# EAGLE design cc1101-breakout (EAGLE 6.5.0)
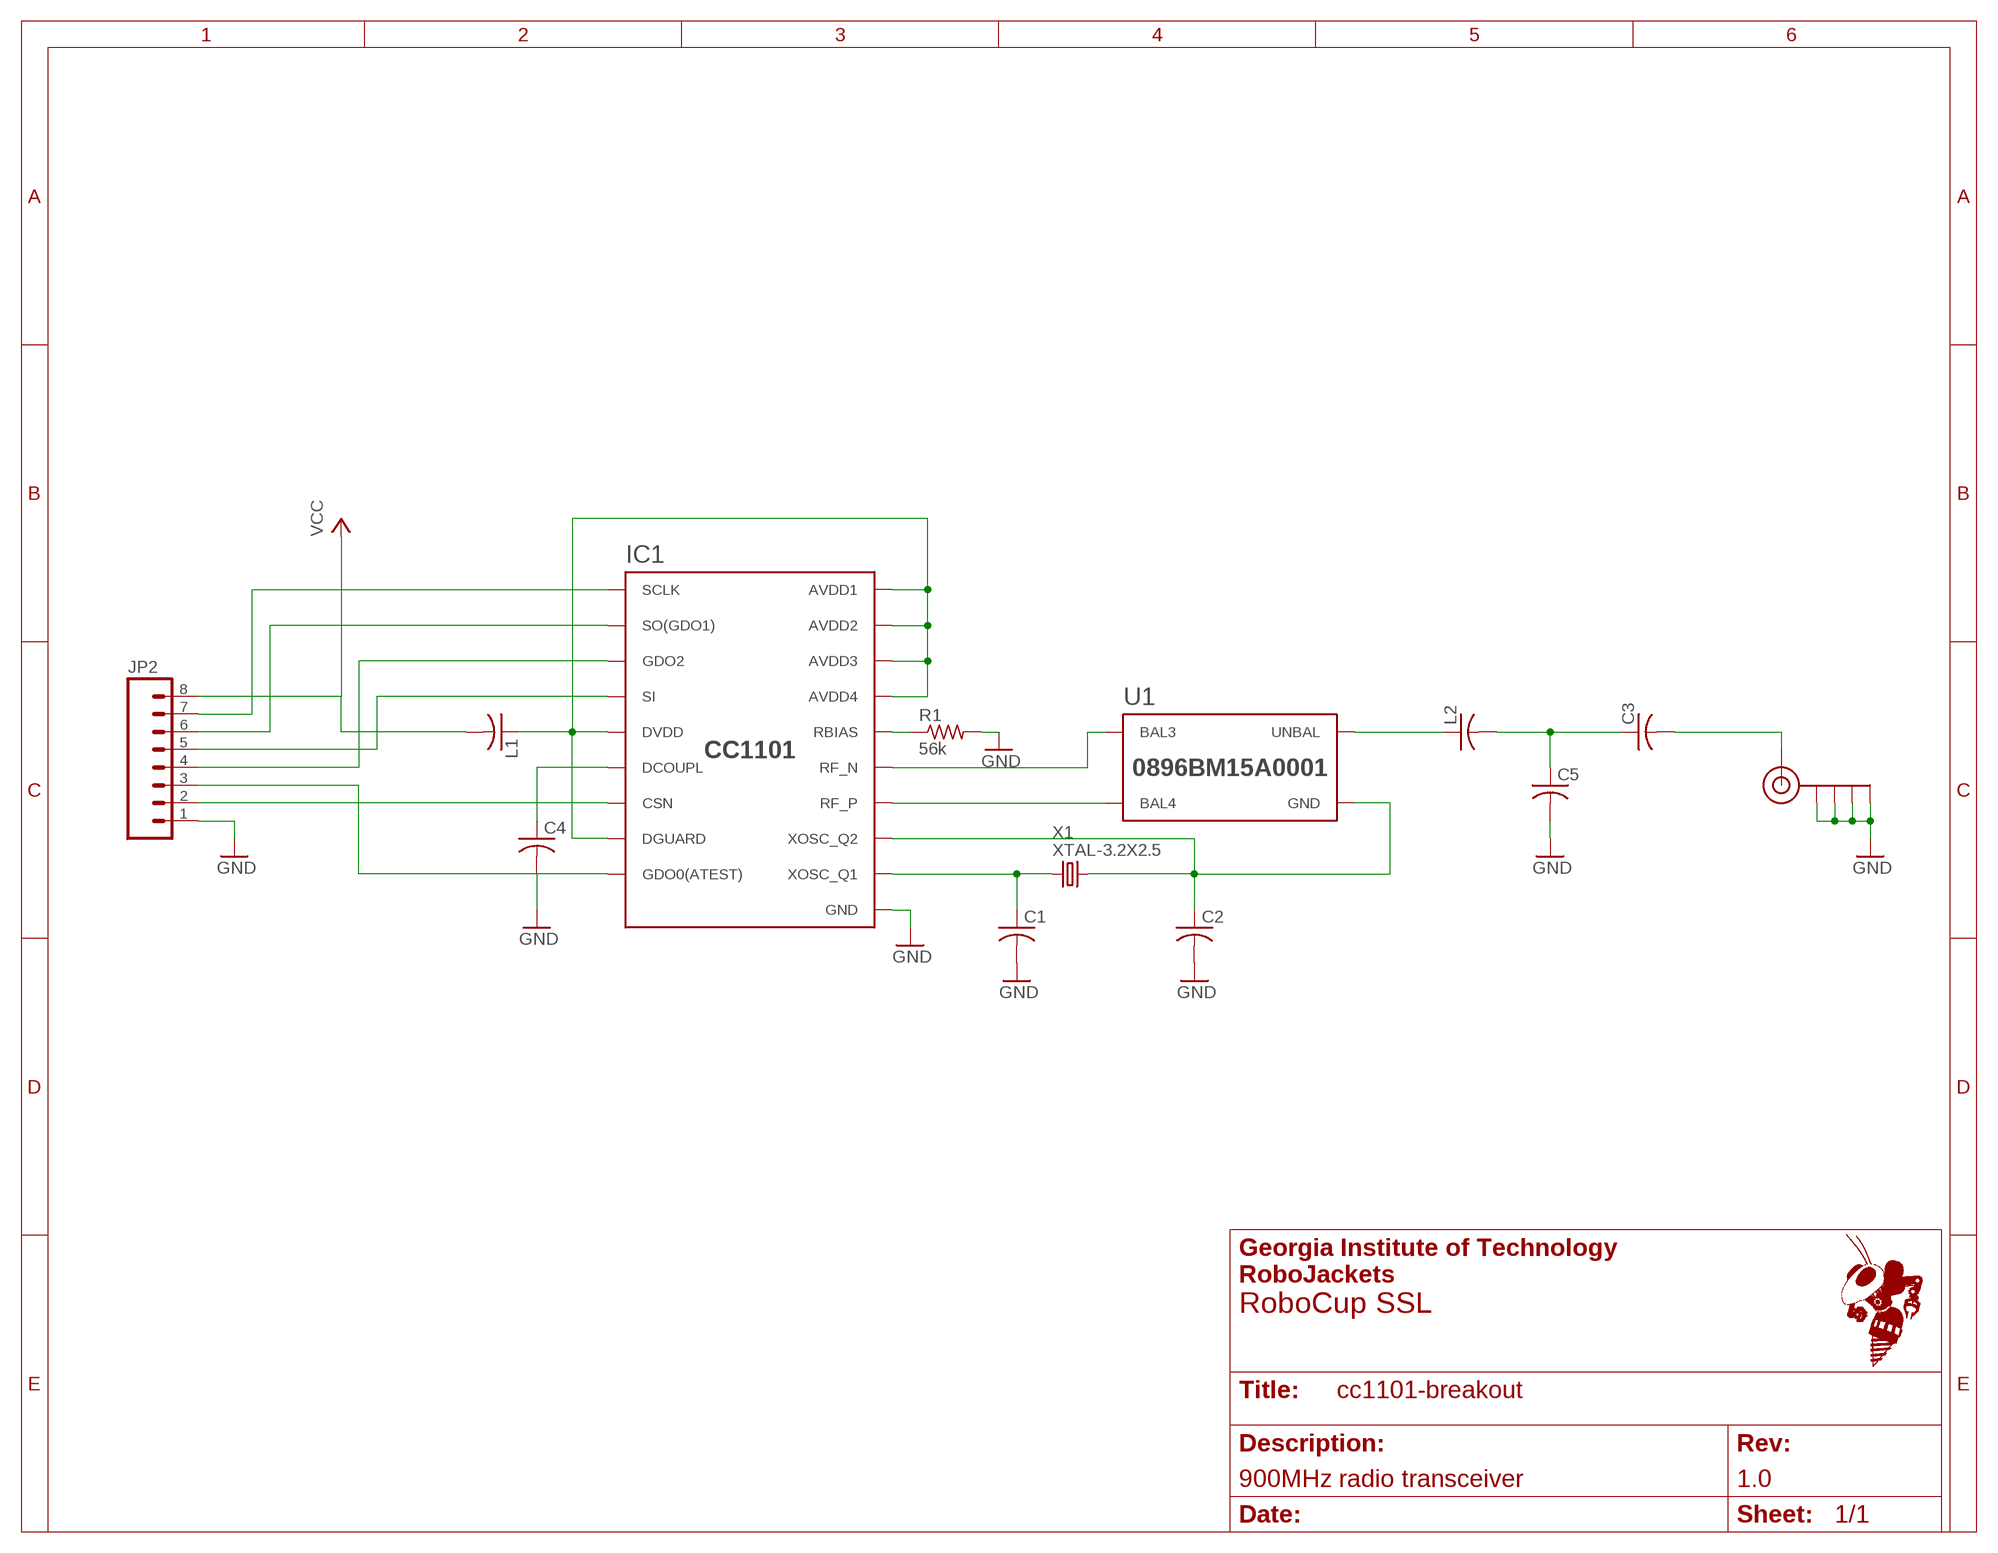
[diagram p0: schematic, sheet 1]
FRAME1 (FRAME_A_L): REVISION: 1.0; SCH_DESC: 900MHz radio transceiver; TEAM: RoboCup SSL

## Parts
C1  C-USC0603  [C0603]
C2  C-USC0603  [C0603]
C3  C-USC0603  [C0603]
C4  C-USC0603  [C0603]
C5  C-USC0402  [C0402]
IC1  CC1101  [QLP20]
J$1  SMA_EDGE  [SMA-EDGE]
JP2  M081X08  [1X08]
L1  C-USC0603  [C0603]
L2  C-USC0402  [C0402]
R1  56k  R-US_R0603  [R0603]
U1  0896BM15A0001  [0896BM15A0001]
X1  XTAL-3.2X2.5  [XTAL-3.2X2.5]

## Nets
GND: C1.2 C2.2 C4.2 C5.2 IC1.16(GND) IC1.19(GND) IC1.GND IC1.GND1(GND) IC1.GND2(GND) IC1.GND3(GND) IC1.GND4(GND) IC1.GND5(GND) J$1.GND@0(GND) J$1.GND@1(GND) J$1.GND@2(GND) J$1.GND@3(GND) JP2.1 R1.2
N$1: IC1.12(RF_P) U1.4(BAL4)
N$2: IC1.13(RF_N) U1.3(BAL3)
N$3: IC1.1(SCLK) JP2.7
N$4: C1.1 IC1.8(XOSC_Q1) X1.1
N$5: C2.1 IC1.10(XOSC_Q2) U1.2(GND) U1.5(GND) U1.6(GND) X1.3
N$6: IC1.17(RBIAS) R1.1
N$7: IC1.2(SO(GDO1)) JP2.6
N$8: IC1.20(SI) JP2.5
N$9: L2.1 U1.1(UNBAL)
N$10: IC1.3(GDO2) JP2.4
N$11: IC1.6(GDO0(ATEST)) JP2.3
N$12: IC1.7(CSN) JP2.2
N$13: C4.1 IC1.5(DCOUPL)
N$14: C3.1 C5.1 L2.2
N$15: C3.2 J$1.SIG(SIGNAL)
N$16: IC1.4(DVDD) IC1.9(AVDD1) IC1.11(AVDD2) IC1.14(AVDD3) IC1.15(AVDD4) IC1.18(DGUARD) L1.1
VCC: JP2.8 L1.2

## Library data of the parts
C1-C5 L1 L2 = rcl:C-US: CAPACITOR, American symbol
IC1 = RoboJackets-RF:CC1101
J$1 = NRF24LU1+_Breakout-v11:SMA_EDGE: SMA Antenna Connector End launch SMA connector. The paste layer has been removed so that the connector can be hand soldered onto the board after reflow.
JP2 = SparkFun-Connectors:M08: Header 8 Standard 8-pin 0.1" header. Use with straight break away headers (SKU : PRT-00116), right angle break away headers (PRT-00553), swiss pins (PRT-00743), machine pins (PRT-00117), and female headers (PRT-00115).
R1 = rcl:R-US_: RESISTOR, American symbol
U1 = RoboJackets-RF:0896BM15A0001
X1 = RoboJackets-FreqGen:XTAL

## Board
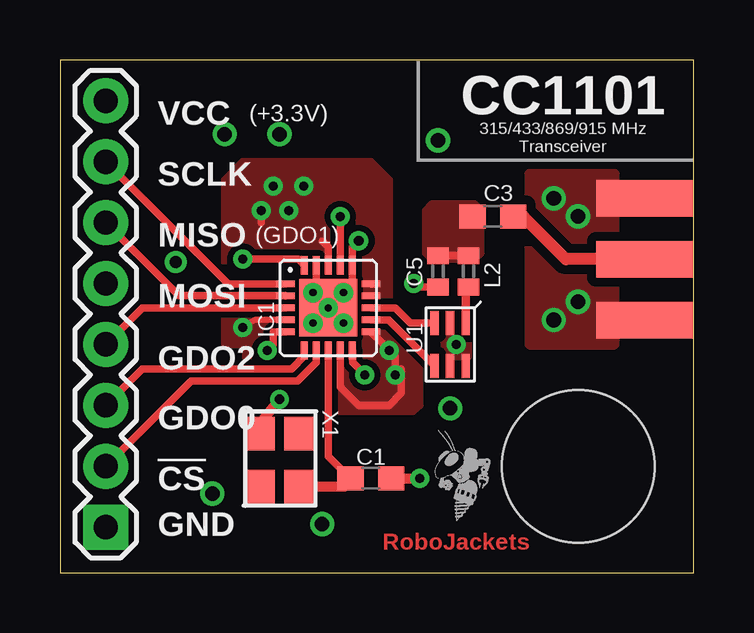
[diagram p1: board, top side]
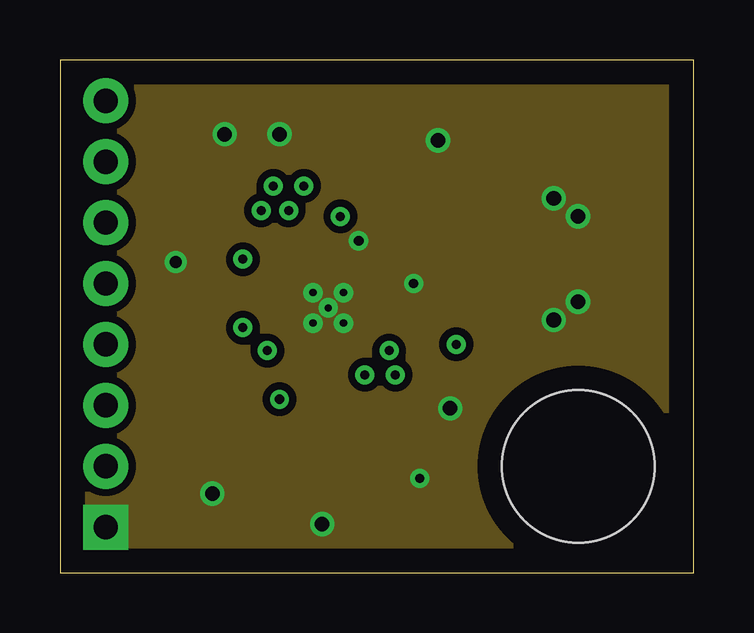
[diagram p2: board, inner layer GND]
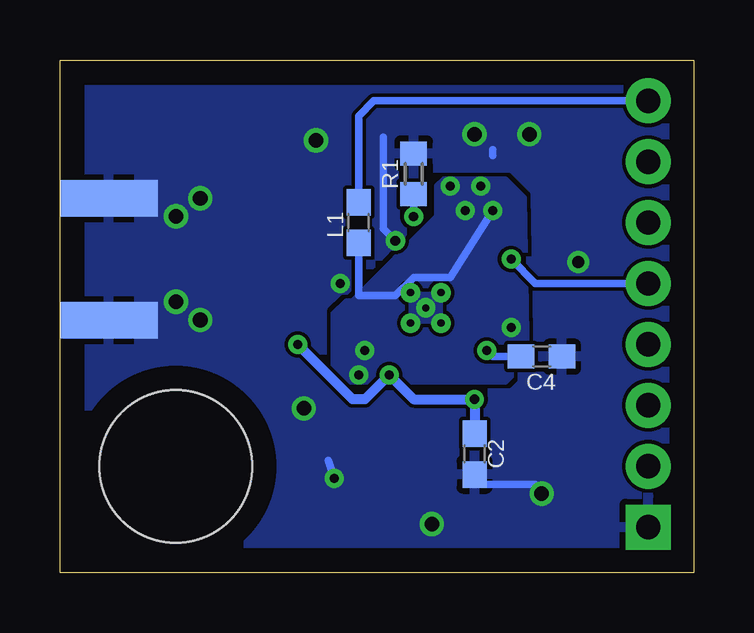
[diagram p3: board, bottom side, seen from below]

Size 26.4 x 21.39 mm. Coordinates in mm from the lower left corner, seen from the top.
Outline: 0,0 26.4,0 26.4,21.39 0,21.39 0,0
Copper layers (1+2*3+16): Top 0.0356mm / dielectric 63mil / GND 0.035mm / dielectric 0.15mm / Route3 0.035mm / dielectric 0.2mm / Bottom 0.0356mm
Design rules "default *": minimum track width 6mil, minimum drill 15mil, track to track 6mil, track to pad 6mil, pad to pad 6mil, via to via 6mil, smd to smd 6mil, copper to edge 40mil, drill to drill 6mil, minimum pad ring 10mil, minimum via ring 8mil, stop-mask expansion 4mil, vias tented up to drill 25mil, thermal gap 10mil
Holes 6.35 mm at 21.59,4.45

### Footprints (pad centres in the part's own frame; a part is rotated, then mirrored left to right if it is on the bottom)
C0603 = smd 1.1 x 1: 1 -0.85,0; 2 0.85,0
C0402 = smd 0.7 x 0.9: 1 -0.65,0; 2 0.65,0
QLP20 = smd 0.76 x 0.28: 1 -1.78,1; 2 -1.78,0.5; 3 -1.78,0; 4 -1.78,-0.5; 5 -1.78,-1; 11 1.78,-1; 12 1.78,-0.5; 13 1.78,0; 14 1.78,0.5; 15 1.78,1 | smd 0.28 x 0.76: 6 -1,-1.78; 7 -0.5,-1.78; 8 0,-1.78; 9 0.5,-1.78; 10 1,-1.78; 16 1,1.78; 17 0.5,1.78; 18 0,1.78; 19 -0.5,1.78; 20 -1,1.78 | smd 2.4 x 2.4: GND 0,0 | drill 0.3: GND1 0,0; GND2 -0.635,0.635; GND3 0.635,0.635; GND4 -0.635,-0.635; GND5 0.635,-0.635
SMA-EDGE = smd 1.524 x 4.064: GND@0 0,0; GND@1 5.08,0; SIG 2.54,0 | smd 1.524 x 4.064 bottom: GND@2 0,0; GND@3 5.08,0
1X08 = drill 1.016 pad 1.88 square: 1 0,0 | drill 1.016 pad 1.88: 2 2.54,0; 3 5.08,0; 4 7.62,0; 5 10.16,0; 6 12.7,0; 7 15.24,0; 8 17.78,0
R0603 = smd 1 x 1.1: 1 -0.85,0; 2 0.85,0
0896BM15A0001 = smd 0.35 x 1: 1 0.65,0.9; 2 0,0.9; 3 -0.65,0.9; 4 -0.65,-0.9; 5 0,-0.9; 6 0.65,-0.9
XTAL-3.2X2.5 = smd 1.4 x 1.2: 1 -1.1,-0.8; 2 1.1,-0.8; 3 1.1,0.8; 4 -1.1,0.8

### Placement (x,y rotation side)
C1  12.95,3.94 0 top
C2  9.14,4.95 270 bottom
C3  18.03,14.86 0 top
C4  6.35,9.02 0 bottom
C5  15.75,12.57 270 top
IC1  11.18,11.05 0 top
J$1  24.38,10.54 90 top
JP2  1.91,1.91 90 top
L1  13.97,14.61 90 bottom
L2  17.02,12.57 90 top
R1  11.68,16.64 90 bottom
U1  16.26,9.53 0 top
U$1  [ROBOBUZZ_0.2X]  16.51,2.16 0 top
X1  9.14,4.7 90 top

### Tracks (layer width: path | path; a pad name or v marks a point on that pad's centre or on a via)
GND  (via drill 0.38, 0.41, 0.51, 0.6, 0.61)
  Top 0.305: C5.2 14.84,11.92 v14.73,12.06 | IC1.19 10.68,11.82 | 10.68,11.82 IC1.GND2 | IC1.GND4 IC1.GND1 | IC1.GND5 IC1.GND1 | 10.68,11.82 11.18,11.32 IC1.GND1 | IC1.GND1 IC1.GND3 12.18,12.05 IC1.16 12.18,13.57 v12.45,13.84
  Top 0.406: C1.2 v14.99,3.94
  Bottom 0.305: 8.38,17.4 8.38,17.65 | v14.99,3.94 15.24,4.7 | v12.45,13.84 12.95,14.35 12.95,18.16 | C2.2 8.72,3.68 6.6,3.68
  other vias: 20.57,15.62 21.59,14.86 21.59,11.3 20.57,10.54 6.35,3.3 10.92,2.03 16.26,6.86 4.83,12.95 15.75,18.03 9.14,18.29 6.86,18.29
  pour Bottom (no thermals): 23.11,16.64 19.56,16.64 19.56,9.53 23.11,9.53
  pour Top (isolate 0.381, no thermals): 23.11,16.64 19.56,16.64 19.56,9.53 23.11,9.53
  pour Bottom (rank 2): 0.76,20.7 0.76,0.51 26.42,0.51 26.16,20.7
  pour GND (isolate 0.305, no thermals): 25.4,20.45 1.02,20.45 1.02,0.51 25.4,0.51
N$1
  Top 0.305: U1.4 15.35,8.9 13.71,10.55 IC1.12
N$2
  Top 0.305: IC1.13 13.97,11.05 14.59,10.43 U1.3
N$3
  Top 0.305: IC1.1 7,12.05 JP2.7
N$4
  Top 0.305: 11.85,3.6 C1.1 11.18,4.87 IC1.8
  Top 0.406: X1.1 11.85,3.6
N$5  (via drill 0.38)
  Top 0.305: IC1.10 12.19,9.25 12.19,8.76 v12.7,8.26 | 8.34,6.26 X1.3 | v16.51,9.53 16.76,9.53
  Top 0.406: v9.14,7.24 8.34,6.26
  Bottom 0.406: v16.51,9.53 14.22,7.24 13.72,7.24 v12.7,8.26 11.68,7.24 v9.14,7.24 C2.1
  pour Top (isolate 0.305, no thermals): 16,10.03 16,9.02 17.02,9.02 17.02,10.03
N$6  (via drill 0.38)
  Top 0.305: IC1.17 v11.68,14.86
  Bottom 0.305: v11.68,14.86 R1.1
N$7
  Top 0.305: JP2.6 4.95,11.56 9.39,11.56 IC1.2
N$8  (via drill 0.38)
  Top 0.305: IC1.20 9.92,13.08 v7.62,13.08
  Bottom 0.305: v7.62,13.08 6.6,12.06 JP2.5
N$9
  Top 0.305: 16.91,11.92 L2.1
  Top 0.356: U1.1 16.91,11.92
N$10
  Top 0.305: IC1.3 3.43,11.05 JP2.4
N$11
  Top 0.305: IC1.6 10.18,9.03 9.65,8.51 3.43,8.51 JP2.3
N$12
  Top 0.305: IC1.7 10.68,8.77 9.91,8 5.46,8 JP2.2
N$13  (via drill 0.38)
  Top 0.305: IC1.5 8.91,10.05 8.89,10.03 8.89,9.53 v8.64,9.27
  Bottom 0.305: v8.64,9.27 8.38,9.02 C4.1
N$14
  Top 0.305: C5.1 L2.2
  pour Top (no thermals): 15.49,13.08 17.27,13.08 17.53,13.34 17.53,15.11 17.27,15.37 15.49,15.37 15.24,15.11 15.24,13.34
N$15
  Top 0.508: J$1.SIG 21.08,13.08 19.3,14.86 C3.2
N$16  (via drill 0.38)
  Top 0.254: IC1.4 8.12,10.55 v7.62,10.22
  Top 0.305: IC1.15 13.19,12.05 13.21,12.06 | IC1.18 11.18,13.59 10.92,13.84 | IC1.11 13.46,9.54 13.46,9.53 13.97,9.02 v13.97,8.26 14.22,8.51 14.22,7.49 13.72,6.99 12.45,6.99 11.68,7.75 IC1.9 | v8.38,15.11 8.38,14.61
  Bottom 0.305: L1.1 13.97,11.56 12.45,11.56 11.68,12.32 10.16,12.32 v8.38,15.11
  other vias: 10.16,16.13 9.53,15.11 8.89,16.13 13.72,9.27
  pour Top (isolate 0.254, no thermals): 9.14,8.38 7.75,8.38 7.75,9.53 6.86,9.53 6.86,16.38 7.62,17.14 12.95,17.14 13.72,16.38 13.72,10.29 13.97,10.03 14.22,10.03 15.24,9.02 14.99,8.76 14.99,6.99 14.71,6.73 9.12,6.73
  pour Bottom: 7.87,8 14.73,8 14.99,8.26 14.99,10.79 14.48,11.3 14.22,11.3 10.67,14.86 10.67,16.13 10.41,16.38 7.87,16.38 7.11,15.62 6.99,8.76 7.11,8.76
VCC
  Bottom 0.305: JP2.8 13.34,19.68 13.97,19.05 L1.2

### Text on the board
Top: RoboJackets
tPlace: CC1101 | VCC | (+3.3V) | 315/433/869/915 MHz / Transceiver | SCLK | MISO | (GDO1) | MOSI | GDO2 | GDO0 | !CS! | GND